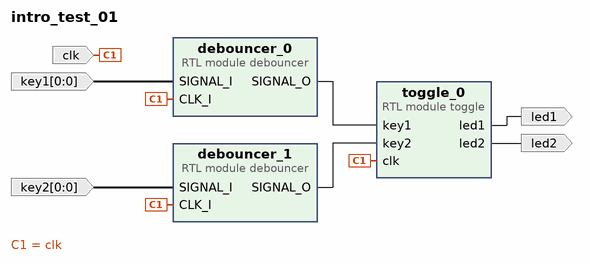
[diagram p0: block diagram of the top level]
# Vivado block design intro_test_01, xc7z010clg400-1, Vivado 2022.2
create_bd_design intro_test_01

create_bd_port -dir I clk
create_bd_port -dir I -from 0 -to 0 key1
create_bd_port -dir I -from 0 -to 0 key2
create_bd_port -dir O led1
create_bd_port -dir O led2

create_bd_cell -type module -reference debouncer debouncer_0
create_bd_cell -type module -reference debouncer debouncer_1
create_bd_cell -type module -reference toggle toggle_0

# ---- connections ----

connect_bd_net -net CLK_I_0_1 [get_bd_ports clk] [get_bd_pins debouncer_0/CLK_I] [get_bd_pins debouncer_1/CLK_I] [get_bd_pins toggle_0/clk]
connect_bd_net -net SIGNAL_I_0_1 [get_bd_ports key1] [get_bd_pins debouncer_0/SIGNAL_I]
connect_bd_net -net SIGNAL_I_1_1 [get_bd_ports key2] [get_bd_pins debouncer_1/SIGNAL_I]
connect_bd_net [get_bd_pins debouncer_0/SIGNAL_O] [get_bd_pins toggle_0/key1]
connect_bd_net [get_bd_pins debouncer_1/SIGNAL_O] [get_bd_pins toggle_0/key2]
connect_bd_net [get_bd_pins toggle_0/led1] [get_bd_ports led1]
connect_bd_net [get_bd_pins toggle_0/led2] [get_bd_ports led2]

validate_bd_design
save_bd_design
